# Altium project DT10965_MOTOR_CONTROLLER.PrjPcb (part 8 of 8)
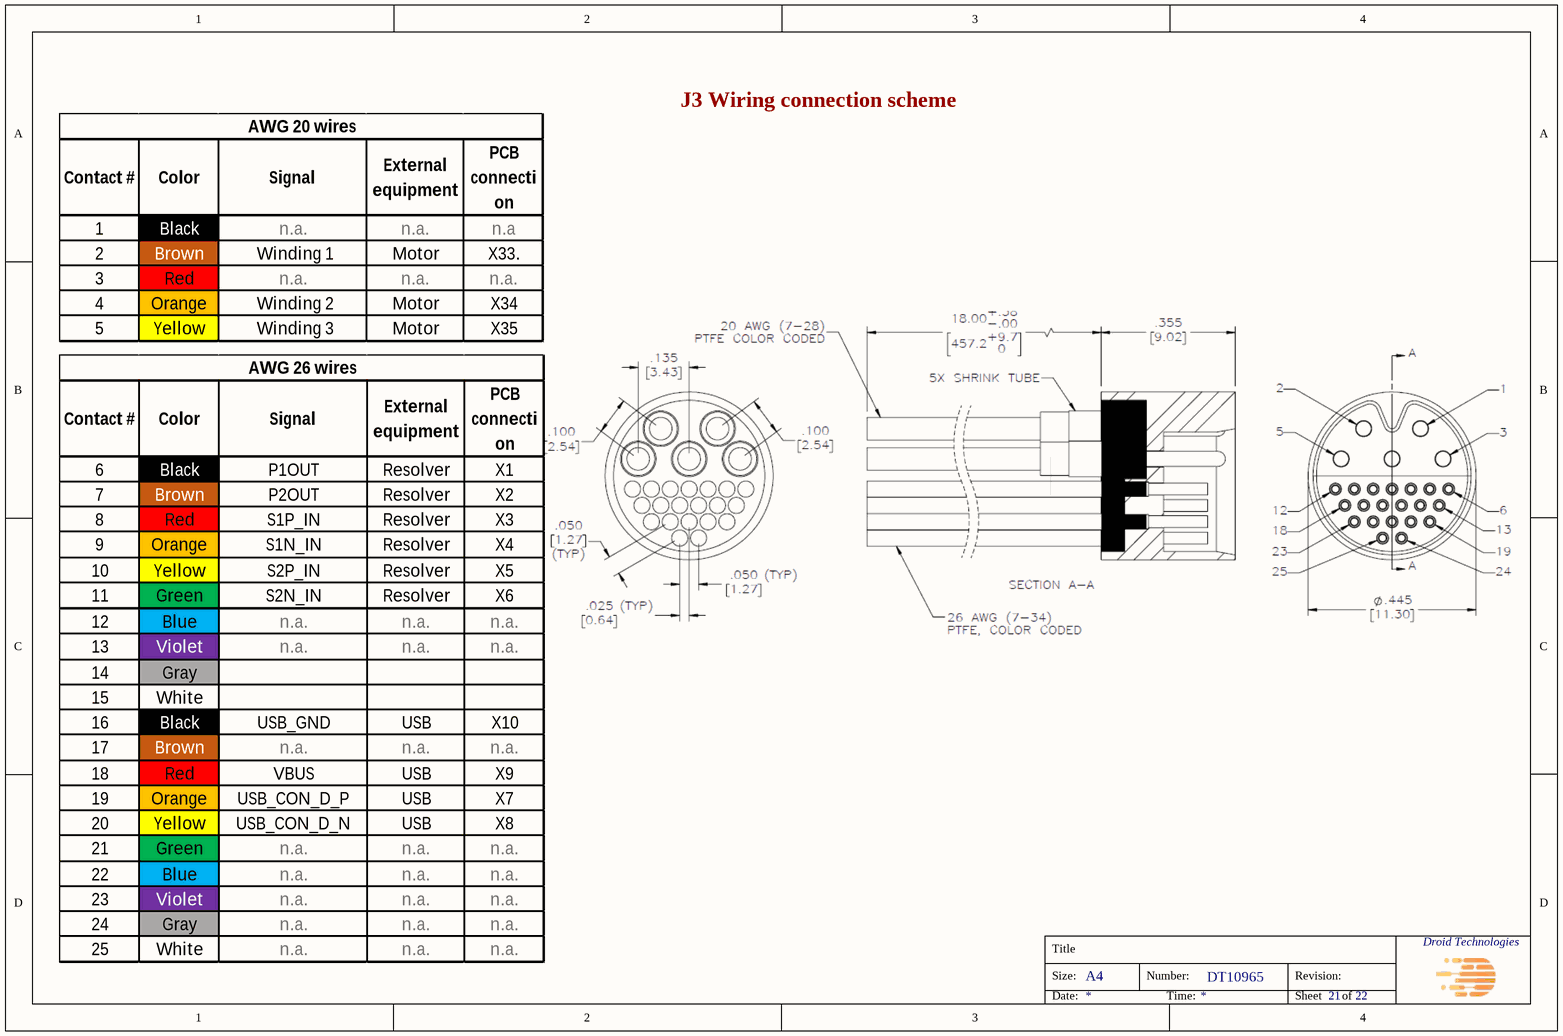
[diagram p22: Wiring_connection_scheme_J3.SchDoc]

## Nets that join several sheets
+3V3: MCU (6 pins), MCU_debug (C41.2 FB4.1), Flash_memory (FB5.1), EEPROM_memory (FB6.1), Temp_sensor (FB7.1), Accelerometers (FB8.1 FB9.2 FB10.2), H-bridge (C81.2 U17.5), Phase_Current_Voltage_Sense (14 pins), Calendar (FB13.1), USB_interface (D8.1), Power_management (20 pins), Motor Voltage AMP (D1.1 D2.1 D3.1 D4.1)
+5V0: Phase_Current_Voltage_Sense (FB11.1), Pressure_sensor_AFE1 (FB12.1), USB_interface (D5.1 R204.2), Power_management (14 pins), Pressure_sensor_AFE2 (FB17.1), Pressure_sensor_AFE3 (FB18.1), PGA900_AFE_Reserved_4 (FB16.1), PGA900_AFE_Reserved_5 (FB19.1)
+12V0: H-bridge (6 pins), Power_management (7 pins)
AGND: MCU (8 pins), Phase_Current_Voltage_Sense (R242.2), Power_management (11 pins), Motor Voltage AMP (C4.1 C5.1 C6.1 C7.1)
BAT_RTC: Connection_scheme (X36.1), Calendar (D10.2)
DGND: Connection_scheme (R70.1 R160.1 R288.1 X37.1), MCU (34 pins), MCU_debug (C41.1 J1.4 J1.8), Flash_memory (23 pins), EEPROM_memory (5 pins), Temp_sensor (C55.1 C56.1 C57.1 U12.2), Accelerometers (18 pins), Resolver (C125.2 U28.24 U28.37), Pressure_sensor_AFE1 (R187.2), Calendar (C150.1 C151.1 U30.4), USB_interface (9 pins), Power_management (29 pins), Pressure_sensor_AFE2 (R244.2), Pressure_sensor_AFE3 (R254.2), PGA900_AFE_Reserved_4 (R229.2), PGA900_AFE_Reserved_5 (R264.2)
GND: Connection_scheme (R70.2 R160.2 R288.2 X32.1), H-bridge (21 pins), Resolver (13 pins), Power_management (27 pins)
VBAT: H-bridge (21 pins), Phase_Current_Voltage_Sense (R131.2), Power_management (25 pins)
VBUS: Connection_scheme (X9.1), USB_interface (5 pins)
VDD_1V2: MCU (18 pins), Power_management (C196.2 FB15.2)
VIN: Connection_scheme (X31.1), Power_management (Q8.5)
VPWR: Resolver (R290.2), Power_management (7 pins)
VREFHIA: MCU (U1.19), Power_management (R224.2 TP45.1 U35.1 U35.4)
VREFHIB: MCU (U1.37), Power_management (R228.2 TP48.1 U38.1 U38.4)
ACCL~{_INT0}: MCU (U1.88), Accelerometers (R109.1)
ACCL~{_INT1}: MCU (U1.96), Accelerometers (R110.1)
CLDR~{_INT}: MCU (U1.97), Calendar (R198.1 TP39.1 U30.3)
FLASH_DEC_A: MCU (U1.81), Flash_memory (U6.1)
FLASH_DEC_B: MCU (U1.82), Flash_memory (U6.2)
FLASH_DEC_C: MCU (U1.86), Flash_memory (U6.3)
I2C_A_SCL: MCU (U1.99), Accelerometers (R107.1), Calendar (R199.2)
I2C_A_SDA: MCU (U1.98), Accelerometers (R108.1), Calendar (R200.2)
I_COMP: MCU (U1.14), H-bridge (U17.2), Phase_Current_Voltage_Sense (TP17.1 U24.4)
IA: MCU (U1.22), Phase_Current_Voltage_Sense (R146.1 TP10.1 U19.5)
IB: MCU (U1.21), Phase_Current_Voltage_Sense (R152.1 TP15.1 U22.5)
IC: MCU (U1.20), Phase_Current_Voltage_Sense (R159.1 TP19.1 U25.5)
NetC4_2: MCU (U1.25), Motor Voltage AMP (C4.2 D1.2 R216.2)
NetC5_2: MCU (U1.24), Motor Voltage AMP (C5.2 D2.2 R241.2)
NetC6_2: MCU (U1.23), Motor Voltage AMP (C6.2 D3.2 R275.2)
NetC7_2: MCU (U1.26), Motor Voltage AMP (C7.2 D4.2 R277.2)
NetC70_1: H-bridge (10 pins), Phase_Current_Voltage_Sense (R129.1 R135.2)
NetC77_1: H-bridge (10 pins), Phase_Current_Voltage_Sense (R139.1 R144.2)
NetC85_1: H-bridge (10 pins), Phase_Current_Voltage_Sense (R149.1 R155.2)
NetJ1_1: MCU (R294.1), MCU_debug (J1.1)
NetJ1_2: MCU (R3.1 TP3.1), MCU_debug (J1.2)
NetJ1_3: MCU (R292.1), MCU_debug (J1.3)
NetJ1_7: MCU (R293.1), MCU_debug (J1.7)
NetJ1_9: MCU (R1.1), MCU_debug (J1.9 J1.10)
NetR92_1: MCU (U1.87), Temp_sensor (R92.1)
NetR115_1: MCU (U1.100), H-bridge (R115.1)
NetR117_1: MCU (U1.1), H-bridge (R117.1)
NetR120_1: MCU (U1.3), H-bridge (R120.1)
NetR122_1: MCU (U1.4), H-bridge (R122.1)
NetR125_1: MCU (U1.5), H-bridge (R125.1)
NetR127_1: MCU (U1.6), H-bridge (R127.1)
NetR129_2: Connection_scheme (X33.1), Phase_Current_Voltage_Sense (R129.2 R130.2 R134.2)
NetR139_2: Connection_scheme (X34.1), Phase_Current_Voltage_Sense (R139.2 R140.2 R143.2)
NetR149_2: Connection_scheme (X35.1), Phase_Current_Voltage_Sense (R149.2 R150.2 R154.2)
NetR169_2: MCU (U1.51), Resolver (R169.2)
NetR171_2: MCU (U1.61), Resolver (R171.2)
NetR189_2: MCU (U1.53), Pressure_sensor_AFE1 (R189.2 TP92.1)
NetR190_1: Connection_scheme (X13.1), Pressure_sensor_AFE1 (R190.1)
NetR192_1: Connection_scheme (X14.1), Pressure_sensor_AFE1 (R192.1)
NetR201_1: Connection_scheme (X10.1), USB_interface (R201.1)
NetR232_1: Connection_scheme (X25.1), PGA900_AFE_Reserved_4 (R232.1)
NetR234_1: Connection_scheme (X26.1), PGA900_AFE_Reserved_4 (R234.1)
NetR247_1: Connection_scheme (X17.1), Pressure_sensor_AFE2 (R247.1)
NetR249_1: Connection_scheme (X18.1), Pressure_sensor_AFE2 (R249.1)
NetR257_1: Connection_scheme (X21.1), Pressure_sensor_AFE3 (R257.1)
NetR259_1: Connection_scheme (X22.1), Pressure_sensor_AFE3 (R259.1)
NetR267_1: Connection_scheme (X29.1), PGA900_AFE_Reserved_5 (R267.1)
NetR269_1: Connection_scheme (X30.1), PGA900_AFE_Reserved_5 (R269.1)
NetTP29_1: Connection_scheme (X11.1), Pressure_sensor_AFE1 (TP29.1 U29.15)
NetTP30_1: Connection_scheme (X12.1), Pressure_sensor_AFE1 (TP30.1 U29.14)
NetTP50_1: Connection_scheme (X23.1), PGA900_AFE_Reserved_4 (TP50.1 U39.15)
NetTP51_1: Connection_scheme (X24.1), PGA900_AFE_Reserved_4 (TP51.1 U39.14)
NetTP61_1: Connection_scheme (X15.1), Pressure_sensor_AFE2 (TP61.1 U40.15)
NetTP62_1: Connection_scheme (X16.1), Pressure_sensor_AFE2 (TP62.1 U40.14)
NetTP71_1: Connection_scheme (X19.1), Pressure_sensor_AFE3 (TP71.1 U41.15)
NetTP72_1: Connection_scheme (X20.1), Pressure_sensor_AFE3 (TP72.1 U41.14)
NetTP81_1: Connection_scheme (X27.1), PGA900_AFE_Reserved_5 (TP81.1 U42.15)
NetTP82_1: Connection_scheme (X28.1), PGA900_AFE_Reserved_5 (TP82.1 U42.14)
NetU1_93: MCU (U1.93), H-bridge (U17.1)
P1OUT: Connection_scheme (X1.1), Resolver (C112.1 R161.2 TP21.1 U27.13)
P2OUT: Connection_scheme (X2.1), Resolver (C123.1 R167.2 TP22.1 U27.9)
PS_EN_2: MCU (U1.57), Pressure_sensor_AFE2 (R246.2 TP94.1)
PS_EN_3: MCU (U1.58), Pressure_sensor_AFE3 (R256.2 TP95.1)
PS_EN_4: MCU (U1.59), PGA900_AFE_Reserved_4 (R231.2 TP93.1)
PS_EN_5: MCU (U1.60), PGA900_AFE_Reserved_5 (R266.2 TP96.1)
S1N_IN: Connection_scheme (X4.1), Resolver (C128.2 R181.2)
S1P_IN: Connection_scheme (X3.1), Resolver (C127.2 R176.2)
S2N_IN: Connection_scheme (X6.1), Resolver (C139.2 R186.2)
S2P_IN: Connection_scheme (X5.1), Resolver (C138.2 R183.2)
SPI_A_EN: MCU (U1.11), Accelerometers (R99.1)
SPI_A_MISO: MCU (U1.8), Accelerometers (R101.1)
SPI_A_MOSI: MCU (U1.7), Accelerometers (R100.2)
SPI_A_SCK: MCU (U1.9), Accelerometers (R102.2)
SPI_B_CLK: MCU (U1.52), EEPROM_memory (R85.1), Temp_sensor (R94.1), Resolver (R172.2), Pressure_sensor_AFE1 (R191.2), Pressure_sensor_AFE2 (R248.2), Pressure_sensor_AFE3 (R258.2), PGA900_AFE_Reserved_4 (R233.2), PGA900_AFE_Reserved_5 (R268.2)
SPI_B_MISO: MCU (U1.56), EEPROM_memory (R87.1), Temp_sensor (R93.1), Resolver (R173.2), Pressure_sensor_AFE1 (R193.2), Pressure_sensor_AFE2 (R250.2), Pressure_sensor_AFE3 (R260.2), PGA900_AFE_Reserved_4 (R235.2), PGA900_AFE_Reserved_5 (R270.2)
SPI_B_MOSI: MCU (U1.54), EEPROM_memory (R86.1), Resolver (R174.2), Pressure_sensor_AFE1 (R194.2), Pressure_sensor_AFE2 (R251.2), Pressure_sensor_AFE3 (R261.2), PGA900_AFE_Reserved_4 (R236.2), PGA900_AFE_Reserved_5 (R271.2)
SPI_C_CLK: MCU (U1.77), Flash_memory (9 pins)
SPI_C_EN: MCU (TP2.1 U1.80), Flash_memory (R49.2 U6.6)
SPI_C_MISO: MCU (U1.76), Flash_memory (9 pins)
SPI_C_MOSI: MCU (U1.75), Flash_memory (9 pins)
SPI_EEPROM_CS: MCU (U1.91), EEPROM_memory (R84.1)
USB_CON_D_N: Connection_scheme (X8.1), USB_interface (D6.3 D6.4 L1.1)
USB_CON_D_P: Connection_scheme (X7.1), USB_interface (D6.1 D6.6 L1.4)
USB_D_N: MCU (U1.74), USB_interface (R203.2)
USB_D_P: MCU (U1.73), USB_interface (R202.2)
USB_DET: MCU (U1.92), USB_interface (R205.2 TP59.1)
VA: Phase_Current_Voltage_Sense (C89.2 R130.1 R132.2 TP8.1), Motor Voltage AMP (R216.1)
VB: Phase_Current_Voltage_Sense (C97.2 R140.1 R142.2 TP13.1), Motor Voltage AMP (R241.1)
VC: Phase_Current_Voltage_Sense (C106.2 R150.1 R153.2 TP18.1), Motor Voltage AMP (R275.1)
VDC: Phase_Current_Voltage_Sense (C90.2 R131.1 R133.2 TP9.1), Motor Voltage AMP (R277.1)